# Altium schematic sheet LED's Section_2.SchDoc
size A3; DocumentNumber: 5; SheetNumber: 5; SheetTotal: 7
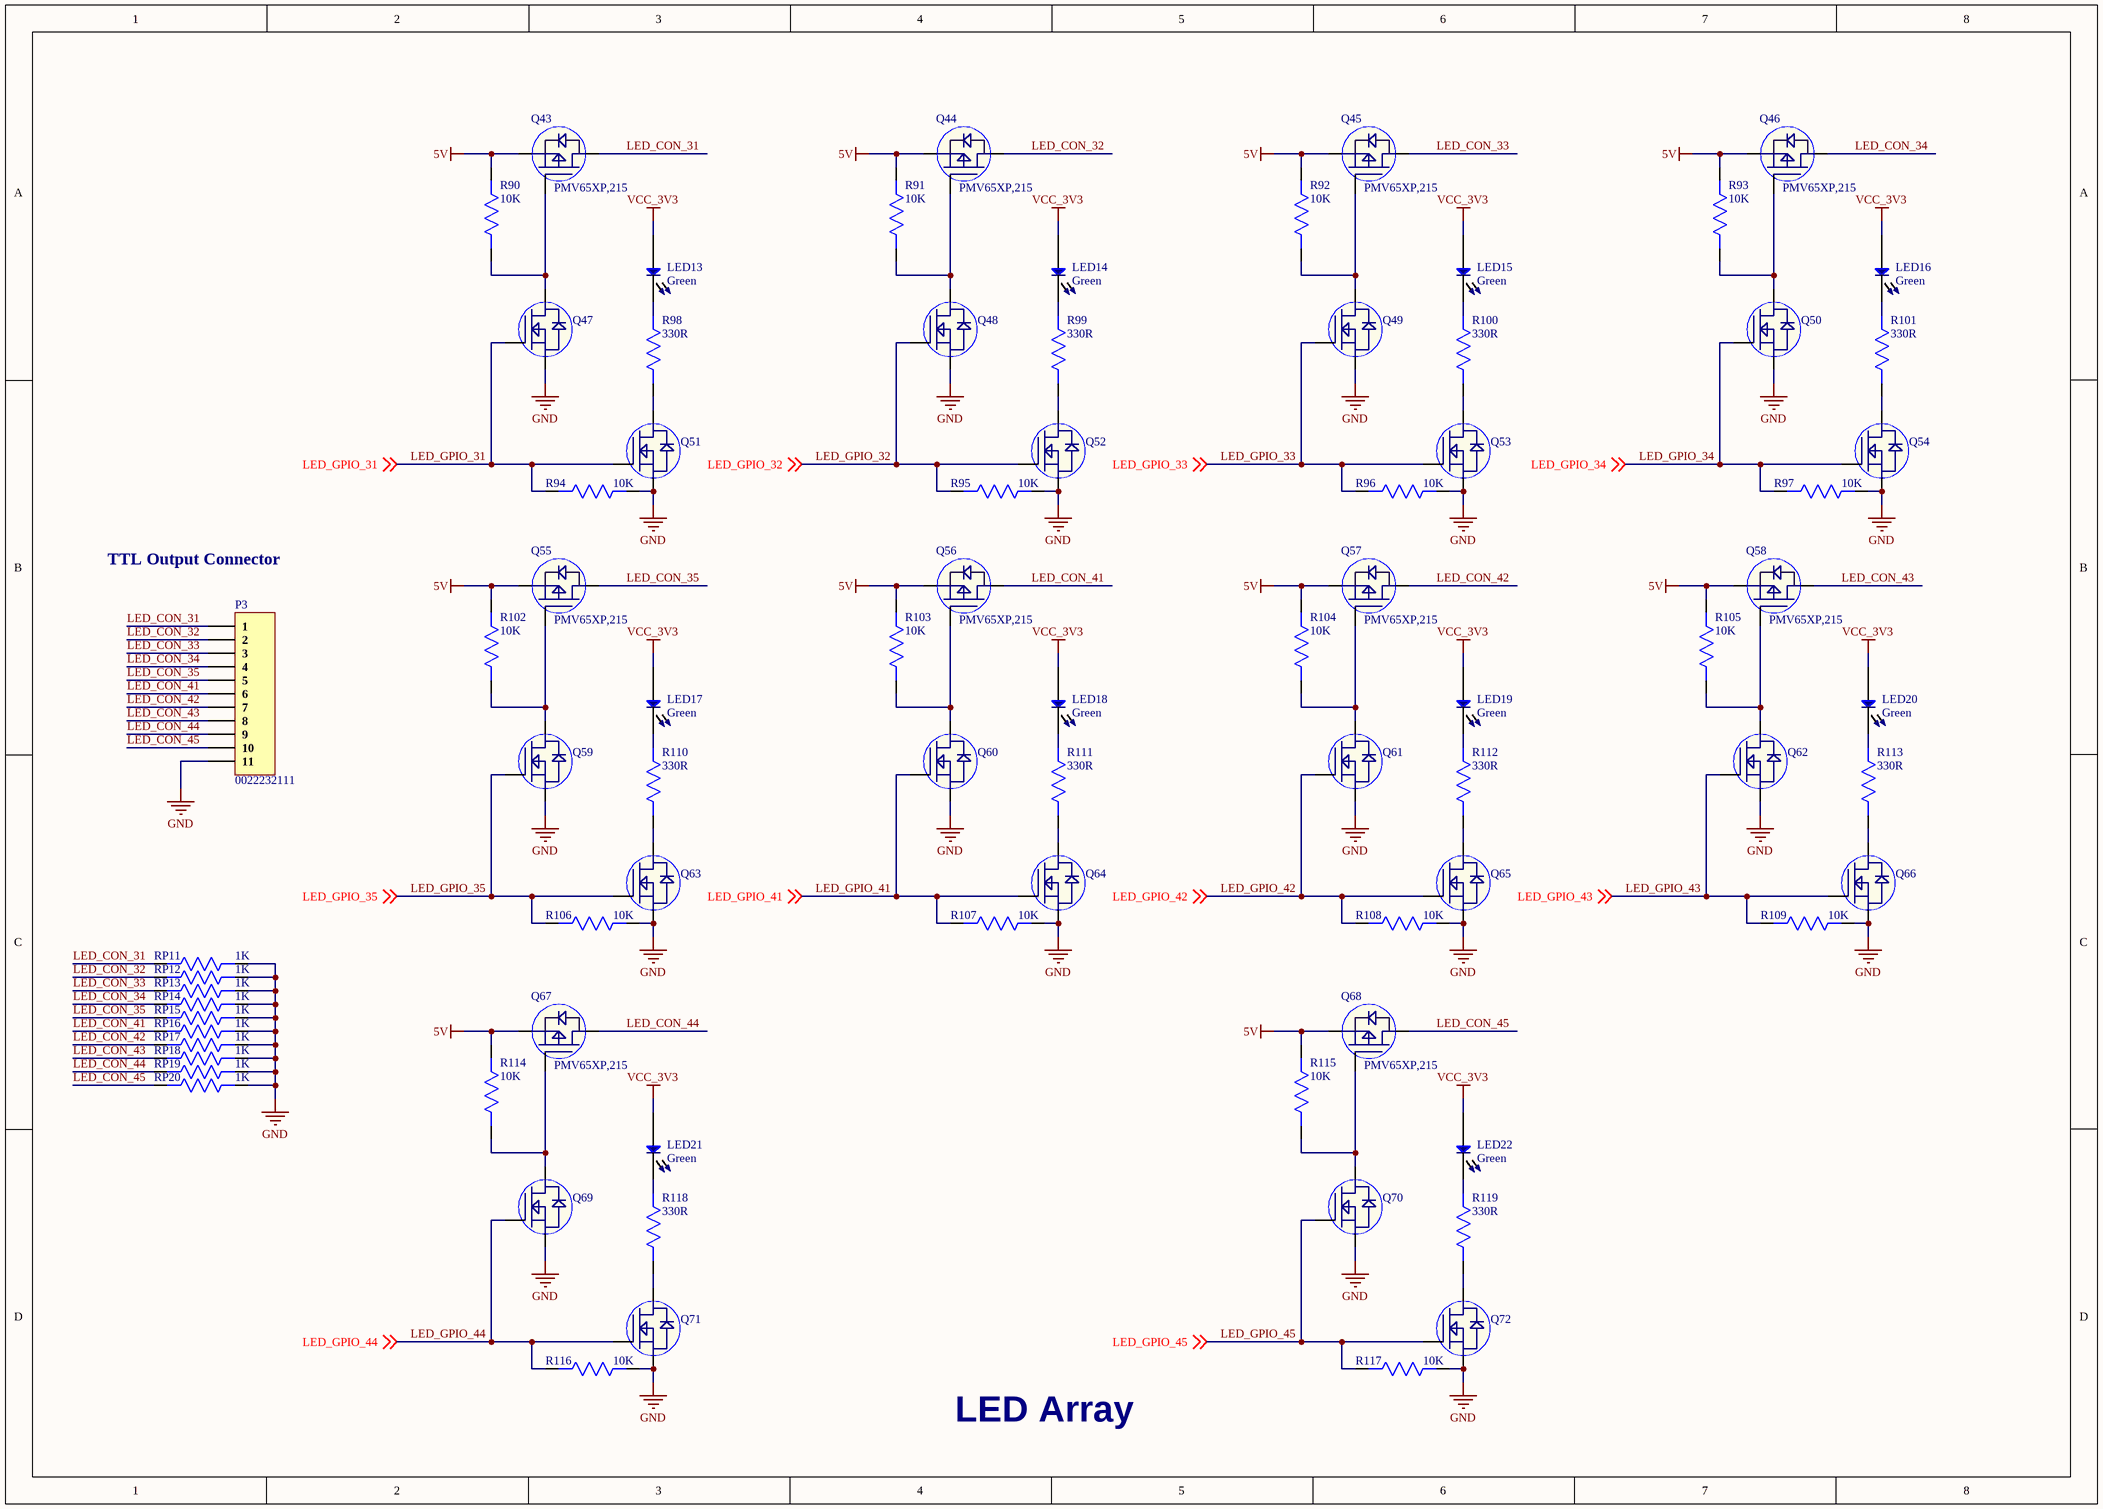
[diagram p0: LED's Section_2.SchDoc]

## Parts
LED13  Color: Green  [LED SMT]  (hidden comment: LTST-C190KGKT)
LED14  Color: Green  [LED SMT]  (hidden comment: LTST-C190KGKT)
LED15  Color: Green  [LED SMT]  (hidden comment: LTST-C190KGKT)
LED16  Color: Green  [LED SMT]  (hidden comment: LTST-C190KGKT)
LED17  Color: Green  [LED SMT]  (hidden comment: LTST-C190KGKT)
LED18  Color: Green  [LED SMT]  (hidden comment: LTST-C190KGKT)
LED19  Color: Green  [LED SMT]  (hidden comment: LTST-C190KGKT)
LED20  Color: Green  [LED SMT]  (hidden comment: LTST-C190KGKT)
LED21  Color: Green  [LED SMT]  (hidden comment: LTST-C190KGKT)
LED22  Color: Green  [LED SMT]  (hidden comment: LTST-C190KGKT)
P3  0022232111  [0022232111]
Q43  PMV65XP,215  [SOT23-3]
Q44  PMV65XP,215  [SOT23-3]
Q45  PMV65XP,215  [SOT23-3]
Q46  PMV65XP,215  [SOT23-3]
Q47  BSS138LT1G  [SOT23-3]  (value not drawn)
Q48  BSS138LT1G  [SOT23-3]  (value not drawn)
Q49  BSS138LT1G  [SOT23-3]  (value not drawn)
Q50  BSS138LT1G  [SOT23-3]  (value not drawn)
Q51  BSS138LT1G  [SOT23-3]  (value not drawn)
Q52  BSS138LT1G  [SOT23-3]  (value not drawn)
Q53  BSS138LT1G  [SOT23-3]  (value not drawn)
Q54  BSS138LT1G  [SOT23-3]  (value not drawn)
Q55  PMV65XP,215  [SOT23-3]
Q56  PMV65XP,215  [SOT23-3]
Q57  PMV65XP,215  [SOT23-3]
Q58  PMV65XP,215  [SOT23-3]
Q59  BSS138LT1G  [SOT23-3]  (value not drawn)
Q60  BSS138LT1G  [SOT23-3]  (value not drawn)
Q61  BSS138LT1G  [SOT23-3]  (value not drawn)
Q62  BSS138LT1G  [SOT23-3]  (value not drawn)
Q63  BSS138LT1G  [SOT23-3]  (value not drawn)
Q64  BSS138LT1G  [SOT23-3]  (value not drawn)
Q65  BSS138LT1G  [SOT23-3]  (value not drawn)
Q66  BSS138LT1G  [SOT23-3]  (value not drawn)
Q67  PMV65XP,215  [SOT23-3]
Q68  PMV65XP,215  [SOT23-3]
Q69  BSS138LT1G  [SOT23-3]  (value not drawn)
Q70  BSS138LT1G  [SOT23-3]  (value not drawn)
Q71  BSS138LT1G  [SOT23-3]  (value not drawn)
Q72  BSS138LT1G  [SOT23-3]  (value not drawn)
R90  10K  [Res0402]
R91  10K  [Res0402]
R92  10K  [Res0402]
R93  10K  [Res0402]
R94  10K  [Res0402]
R95  10K  [Res0402]
R96  10K  [Res0402]
R97  10K  [Res0402]
R98  330R  [Res0402]
R99  330R  [Res0402]
R100  330R  [Res0402]
R101  330R  [Res0402]
R102  10K  [Res0402]
R103  10K  [Res0402]
R104  10K  [Res0402]
R105  10K  [Res0402]
R106  10K  [Res0402]
R107  10K  [Res0402]
R108  10K  [Res0402]
R109  10K  [Res0402]
R110  330R  [Res0402]
R111  330R  [Res0402]
R112  330R  [Res0402]
R113  330R  [Res0402]
R114  10K  [Res0402]
R115  10K  [Res0402]
R116  10K  [Res0402]
R117  10K  [Res0402]
R118  330R  [Res0402]
R119  330R  [Res0402]
RP11  1K  [Res0402]
RP12  1K  [Res0402]
RP13  1K  [Res0402]
RP14  1K  [Res0402]
RP15  1K  [Res0402]
RP16  1K  [Res0402]
RP17  1K  [Res0402]
RP18  1K  [Res0402]
RP19  1K  [Res0402]
RP20  1K  [Res0402]

## Nets
5V: Q43.2(S) Q44.2(S) Q45.2(S) Q46.2(S) Q55.2(S) Q56.2(S) Q57.2(S) Q58.2(S) Q67.2(S) Q68.2(S) R90.2 R91.2 R92.2 R93.2 R102.2 R103.2 R104.2 R105.2 R114.2 R115.2
GND: P3.11 Q47.2(S) Q48.2(S) Q49.2(S) Q50.2(S) Q51.2(S) Q52.2(S) Q53.2(S) Q54.2(S) Q59.2(S) Q60.2(S) Q61.2(S) Q62.2(S) Q63.2(S) Q64.2(S) Q65.2(S) Q66.2(S) Q69.2(S) Q70.2(S) Q71.2(S) Q72.2(S) R94.2 R95.2 R96.2 R97.2 R106.2 R107.2 R108.2 R109.2 R116.2 R117.2 RP11.1 RP12.1 RP13.1 RP14.1 RP15.1 RP16.1 RP17.1 RP18.1 RP19.1 RP20.1
VCC_3V3: LED13.1 LED14.1 LED15.1 LED16.1 LED17.1 LED18.1 LED19.1 LED20.1 LED21.1 LED22.1
LED_CON_31: P3.1 Q43.3(D) RP11.2
LED_CON_32: P3.2 Q44.3(D) RP12.2
LED_CON_33: P3.3 Q45.3(D) RP13.2
LED_CON_34: P3.4 Q46.3(D) RP14.2
LED_CON_35: P3.5 Q55.3(D) RP15.2
LED_CON_41: P3.6 Q56.3(D) RP16.2
LED_CON_42: P3.7 Q57.3(D) RP17.2
LED_CON_43: P3.8 Q58.3(D) RP18.2
LED_CON_44: P3.9 Q67.3(D) RP19.2
LED_CON_45: P3.10 Q68.3(D) RP20.2
LED_GPIO_31: Q47.1(G) Q51.1(G) R94.1 ; off-sheet LED_GPIO_31
LED_GPIO_32: Q48.1(G) Q52.1(G) R95.1 ; off-sheet LED_GPIO_32
LED_GPIO_33: Q49.1(G) Q53.1(G) R96.1 ; off-sheet LED_GPIO_33
LED_GPIO_34: Q50.1(G) Q54.1(G) R97.1 ; off-sheet LED_GPIO_34
LED_GPIO_35: Q59.1(G) Q63.1(G) R106.1 ; off-sheet LED_GPIO_35
LED_GPIO_41: Q60.1(G) Q64.1(G) R107.1 ; off-sheet LED_GPIO_41
LED_GPIO_42: Q61.1(G) Q65.1(G) R108.1 ; off-sheet LED_GPIO_42
LED_GPIO_43: Q62.1(G) Q66.1(G) R109.1 ; off-sheet LED_GPIO_43
LED_GPIO_44: Q69.1(G) Q71.1(G) R116.1 ; off-sheet LED_GPIO_44
LED_GPIO_45: Q70.1(G) Q72.1(G) R117.1 ; off-sheet LED_GPIO_45
NetLED13_2: LED13.2 R98.1
NetLED14_2: LED14.2 R99.1
NetLED15_2: LED15.2 R100.1
NetLED16_2: LED16.2 R101.1
NetLED17_2: LED17.2 R110.1
NetLED18_2: LED18.2 R111.1
NetLED19_2: LED19.2 R112.1
NetLED20_2: LED20.2 R113.1
NetLED21_2: LED21.2 R118.1
NetLED22_2: LED22.2 R119.1
NetQ43_1: Q43.1(G) Q47.3(D) R90.1
NetQ44_1: Q44.1(G) Q48.3(D) R91.1
NetQ45_1: Q45.1(G) Q49.3(D) R92.1
NetQ46_1: Q46.1(G) Q50.3(D) R93.1
NetQ51_3: Q51.3(D) R98.2
NetQ52_3: Q52.3(D) R99.2
NetQ53_3: Q53.3(D) R100.2
NetQ54_3: Q54.3(D) R101.2
NetQ55_1: Q55.1(G) Q59.3(D) R102.1
NetQ56_1: Q56.1(G) Q60.3(D) R103.1
NetQ57_1: Q57.1(G) Q61.3(D) R104.1
NetQ58_1: Q58.1(G) Q62.3(D) R105.1
NetQ63_3: Q63.3(D) R110.2
NetQ64_3: Q64.3(D) R111.2
NetQ65_3: Q65.3(D) R112.2
NetQ66_3: Q66.3(D) R113.2
NetQ67_1: Q67.1(G) Q69.3(D) R114.1
NetQ68_1: Q68.1(G) Q70.3(D) R115.1
NetQ71_3: Q71.3(D) R118.2
NetQ72_3: Q72.3(D) R119.2

## Notes on the sheet
- TTL Output Connector
- LED Array

## Library data of the parts
LED13-LED22 = LTST-C190KGKT: LED GREEN CLEAR CHIP SMD; Manufacturer: Vishay Lite-On; Lens Color: Colorless; Lens Style: Diffused,Colorless,Rectangular,Clear; Forward Voltage: 2V; Luminous Intensity: 35mcd; Viewing Angle: 130°; Dominant Wavelength: 571nm; Test Current: 20mA; Wavelength: 574nm; Forward Current: 30mA; Power Rating: 75mW; Number of Elements: 1; Reverse Voltage: 5V; Supplier 1: Digi-Key; Manufacturer Part Number: LTST-C190KGKT; Stock 1: 1327387; Pricing 1: 1=0.26, 10=0.188, 25=0.138, 100=0.0987, 250=0.06712, 500=0.05922, 1000=0.04639 (USD); Mount: Surface Mount; Case/Package: 0603; Number of Pins: 2; Case Code (Metric): 1608; Case Code (Imperial): 0603; Min Operating Temperature: -55°C; Max Operating Temperature: 85°C; Packaging: Tape and Reel; Package Quantity: 1; Lens Transparency: Clear; Illumination Color: Green; Power Dissipation: 75mW; Number of LEDs: 1; Length: 1.6mm; Height: 0.8mm; Width: 0.8mm; Depth: 0.8mm; Radiation Hardening: No; Lead Free: Lead Free; ComponentLink1URL: https://www.verical.com/server-webapp/html/getDatasheet?partID=141494&src-supplier=Verical; ComponentLink1Description: https://www.verical.com/server-webapp/html/getDatasheet?partID=141494&src-supplier=Verical; ComponentLink2URL: http://optoelectronics.liteon.com/upload/download/DS22-2000-074/LTST-C190KGKT.PDF?src-supplier=Digi-Key; ComponentLink2Description: http://optoelectronics.liteon.com/upload/download/DS22-2000-074/LTST-C190KGKT.PDF?src-supplier=Digi-Key; ComponentLink3URL: http://www.mouser.com/ds/2/239/LTST-C190KGKT-1141861.pdf?src-supplier=Mouser; ComponentLink3Description: http://www.mouser.com/ds/2/239/LTST-C190KGKT-1141861.pdf?src-supplier=Mouser; ComponentLink4URL: http://uk.rs-online.com/webdocs/0dc0/0900766b80dc02a8.pdf?src-supplier=RSComponents; ComponentLink4Description: http://uk.rs-online.com/webdocs/0dc0/0900766b80dc02a8.pdf?src-supplier=RSComponents; Supplier Part Number 1: 160-1435-6-ND
P3 = 0022232111: CONN HEADER VERT 11POS 2.54MM; Manufacturer: Molex; Contact Resistance: 10mR; Number of Contacts: 11; Gender: Male; Supplier 1: Digi-Key; Manufacturer Part Number: 0022232111; Stock 1: 1529; Pricing 1: 1=0.74, 10=0.652, 100=0.5628, 500=0.46046, 1000=0.4093, 5000=0.35813, 10000=0.34023 (USD); Contact Plating: Copper,Tin; Contact Material: Brass; Housing Color: White; Housing Material: Nylon; Min Operating Temperature: 0°C; Max Operating Temperature: 75°C; Number of Rows: 1; Packaging: Bag; Termination: Solder; Orientation: Straight; Length: 27.94mm; Pitch: 2.54mm; Depth: 6.35mm; ComponentLink1URL: http://components.arrow.com/part/dataview/4703620S3674830N3303?src-supplier=Arrow; ComponentLink1Description: http://components.arrow.com/part/dataview/4703620S3674830N3303?src-supplier=Arrow; Supplier Part Number 1: 23-0022232111-ND
Q43-Q46 Q55-Q58 Q67 Q68 = PMV65XP,215: MOSFET P-CH 20V 2.8A SOT-23; Manufacturer: Nexperia; Supplier 1: Digi-Key; Manufacturer Part Number: PMV65XP,215; Stock 1: 60287; Pricing 1: 1=0.38, 10=0.28, 25=0.2452, 100=0.133, 250=0.13232, 500=0.1085, 1000=0.0805 (USD); Supplier Part Number 1: 1727-3124-1-ND
Q47-Q54 Q59-Q66 Q69-Q72 = BSS138LT1G: MOSFET N-CH 50V 200MA SOT-23; Manufacturer: ON Semiconductor; Gate to Source Voltage (Vgs): 20V; Nominal Vgs: 1.5V; Rds On Max: 3.5R; Input Capacitance: 50pF; Number of Elements: 1; Max Power Dissipation: 225mW; Turn-Off Delay Time: 20ns; Element Configuration: Single; ComponentLink1URL: https://datasheet.ciiva.com/22641/1596366-22641636.pdf; ComponentLink1Description: https://datasheet.ciiva.com/22641/1596366-22641636.pdf; ComponentLink2URL: https://datasheet.ciiva.com/1190/1596366-1190137.pdf; ComponentLink2Description: https://datasheet.ciiva.com/1190/1596366-1190137.pdf; ComponentLink3URL: https://datasheet.ciiva.com/15198/getdatasheetpartid-110266-15198908.pdf; ComponentLink3Description: https://datasheet.ciiva.com/15198/getdatasheetpartid-110266-15198908.pdf; ComponentLink4URL: https://datasheet.ciiva.com/8115/bss138lt1-d-8115295.pdf; ComponentLink4Description: https://datasheet.ciiva.com/8115/bss138lt1-d-8115295.pdf; ComponentLink5URL: https://datasheet.ciiva.com/8115/bss138lt1-d-8115358.pdf; ComponentLink5Description: https://datasheet.ciiva.com/8115/bss138lt1-d-8115358.pdf; ComponentLink6URL: https://datasheet.ciiva.com/1190/1596366-1190136.pdf; ComponentLink6Description: https://datasheet.ciiva.com/1190/1596366-1190136.pdf; ComponentLink7URL: https://datasheet.ciiva.com/936/bss138lt1-d-936802.pdf; ComponentLink7Description: https://datasheet.ciiva.com/936/bss138lt1-d-936802.pdf; ComponentLink8URL: https://datasheet.ciiva.com/936/bss138lt1-d-936801.pdf; ComponentLink8Description: https://datasheet.ciiva.com/936/bss138lt1-d-936801.pdf; ComponentLink9URL: https://datasheet.ciiva.com/14553/70099493-14553829.pdf; ComponentLink9Description: https://datasheet.ciiva.com/14553/70099493-14553829.pdf; ComponentLink10URL: https://datasheet.ciiva.com/936/bss138lt1-d-936803.pdf; ComponentLink10Description: https://datasheet.ciiva.com/936/bss138lt1-d-936803.pdf; Supplier 1: Digi-Key; Manufacturer Part Number: BSS138LT1G; Stock 1: 1283212; Pricing 1: 1=0.27, 10=0.222, 100=0.1177, 500=0.07746, 1000=0.05267 (USD); Case/Package: SOT-23-3; Number of Pins: 3; Contact Plating: Tin,Matte; Min Operating Temperature: -55°C; Max Operating Temperature: 150°C; Continuous Drain Current (ID): 200mA; Package Quantity: 1; Packaging: Tape and Reel; Drain to Source Breakdown Voltage: 50V; Power Dissipation: 225mW; Drain to Source Resistance: 3.5R; Threshold Voltage: 1.5V; Turn-On Delay Time: 20ns; Voltage Rating (DC): 50V; Current Rating: 200mA; On-State Resistance: 3.5R; Length: 3.04mm; Height: 1.01mm; Width: 1.4mm; Radiation Hardening: No; REACH SVHC: No SVHC; Lead Free: Lead Free; Halogen Free: Halogen Free; ComponentLink11URL: http://www.onsemi.com/pub/Collateral/BSS138LT1-D.PDF?src-supplier=Digi-Key; ComponentLink11Description: http://www.onsemi.com/pub/Collateral/BSS138LT1-D.PDF?src-supplier=Digi-Key; ComponentLink12URL: http://www.farnell.com/datasheets/1596366.pdf?src-supplier=Element14; ComponentLink12Description: http://www.farnell.com/datasheets/1596366.pdf?src-supplier=Element14; ComponentLink13URL: http://www.alliedelec.com/m/d/b3c6fd7d92596813fe75d33dcbaaae90.pdf?src-supplier=Allied+Electronics; ComponentLink13Description: http://www.alliedelec.com/m/d/b3c6fd7d92596813fe75d33dcbaaae90.pdf?src-supplier=Allied+Electronics; ComponentLink14URL: https://www.verical.com/server-webapp/html/getDatasheet?partID=110266&src-supplier=Verical; ComponentLink14Description: https://www.verical.com/server-webapp/html/getDatasheet?partID=110266&src-supplier=Verical; ComponentLink15URL: http://www.onsemi.com/pub_link/Collateral/BSS138LT1-D.PDF?src-supplier=Avnet; ComponentLink15Description: http://www.onsemi.com/pub_link/Collateral/BSS138LT1-D.PDF?src-supplier=Avnet; Supplier Part Number 1: BSS138LT1GOSDKR-ND
R90-R97 R102-R109 R114-R117 = RC0402FR-0710KL: RES SMD 10K OHM 1% 1/16W 0402; Manufacturer: Yageo Phycomp; Temperature Coefficient: 100ppm/°C; Resistance: 10000R; Voltage Rating (DC): 50V; Power Rating: 63mW; Supplier 1: Digi-Key; Manufacturer Part Number: RC0402FR-0710KL; Stock 1: 98435877; Pricing 1: 1=0.1, 10=0.016, 100=0.0067, 1000=0.00301, 2500=0.00261, 5000=0.00215 (USD); Mount: Surface Mount; Case/Package: 0402; Number of Pins: 2; Min Operating Temperature: -55°C; Max Operating Temperature: 155°C; Tolerance: 1%; Packaging: Cut Tape; Length: 1mm; Height: 0.32mm; Width: 500um; Depth: 0.5mm; REACH SVHC: No SVHC; Lead Free: Lead Free; Supplier Part Number 1: 311-10.0KLRCT-ND
R98-R101 R110-R113 R118 R119 = RC0402FR-07330RL: RES SMD 330 OHM 1% 1/16W 0402; Manufacturer: Yageo; Power Rating: 62.5mW; Voltage Rating: 50V; Temperature Coefficient: 100ppm/°C; Max Power Dissipation: 63mW; ComponentLink1URL: http://www.farnell.com/datasheets/1784430.pdf?src-supplier=Element14; ComponentLink1Description: http://www.farnell.com/datasheets/1784430.pdf?src-supplier=Element14; ComponentLink2URL: http://www.yageo.com/documents/recent/PYu-RC_Group_51_RoHS_L_9.pdf?src-supplier=Mouser; ComponentLink2Description: http://www.yageo.com/documents/recent/PYu-RC_Group_51_RoHS_L_9.pdf?src-supplier=Mouser; ComponentLink3URL: http://www.yageo.com/documents/recent/PYu-RC0402_51_RoHS_L_6_r.pdf?src-supplier=Future+Electronics; ComponentLink3Description: http://www.yageo.com/documents/recent/PYu-RC0402_51_RoHS_L_6_r.pdf?src-supplier=Future+Electronics; ComponentLink4URL: https://www.verical.com/server-webapp/html/getDatasheet?partID=329466&src-supplier=Verical; ComponentLink4Description: https://www.verical.com/server-webapp/html/getDatasheet?partID=329466&src-supplier=Verical; ComponentLink5URL: http://www.farnell.com/datasheets/1018594.pdf?src-supplier=Element14; ComponentLink5Description: http://www.farnell.com/datasheets/1018594.pdf?src-supplier=Element14; ComponentLink6URL: http://www.farnell.com/datasheets/2167052.pdf?src-supplier=Element14; ComponentLink6Description: http://www.farnell.com/datasheets/2167052.pdf?src-supplier=Element14; ComponentLink7URL: http://documents.rs-components.com/techlib://itc_doclist_GB.htm?stockno=6185810&src-supplier=RSComponents; ComponentLink7Description: http://documents.rs-components.com/techlib://itc_doclist_GB.htm?stockno=6185810&src-supplier=RSComponents; Supplier 1: Digi-Key; Manufacturer Part Number: RC0402FR-07330RL; Stock 1: 6258760; Pricing 1: 1=0.1, 10=0.016, 100=0.0067, 1000=0.003, 2500=0.0026, 5000=0.0022 (USD); Case/Package: 0402; Case Code (Metric): 1005; Case Code (Imperial): 0402; Min Operating Temperature: -55°C; Max Operating Temperature: 155°C; Packaging: Tape and Reel; Resistance: 330R; Tolerance: 1%; Composition: Thick Film; Termination: SMD/SMT; Military Standard: Not; Package Quantity: 1; Number of Terminations: 2; Features: Moisture Resistant; Length: 0.039inch; Height: 0.016inch; Depth: 0.5mm; Width: 0.02inch; REACH SVHC: Unknown; Lead Free: Lead Free; ComponentLink8URL: http://www.yageo.com/documents/recent/PYu-RC_Group_51_RoHS_L_10.pdf?src-supplier=Digi-Key; ComponentLink8Description: http://www.yageo.com/documents/recent/PYu-RC_Group_51_RoHS_L_10.pdf?src-supplier=Digi-Key; ComponentLink9URL: http://www.mouser.com/ds/2/447/PYu-RC0402_51_RoHS_L_6_r-8721.pdf?src-supplier=Mouser; ComponentLink9Description: http://www.mouser.com/ds/2/447/PYu-RC0402_51_RoHS_L_6_r-8721.pdf?src-supplier=Mouser; Supplier Part Number 1: 311-330LRCT-ND
RP11-RP20 = AT0402FRE071KL: RES SMD 1K OHM 1% 1/16W 0402; Manufacturer: Yageo; Resistance: 1kR; Max Power Dissipation: 63mW; Temperature Coefficient: 50ppm/°C; Supplier 1: Digi-Key; Manufacturer Part Number: AT0402FRE071KL; RoHS: Yes; Category: Chip SMD Resistors; Stock 1: 559; Pricing 1: 1=0.14000, 10=0.11800, 100=0.04620, 1000=0.01935, 2500=0.01774, 5000=0.01612 (USD); Case/Package: 0402; Case Code (Metric): 1005; Case Code (Imperial): 0402; Min Operating Temperature: -55°C; Max Operating Temperature: 155°C; Packaging: Tape and Reel; Resistor Type: Thin Film; Number of Terminations: 2; Tolerance: 1%; Features: Moisture Resistant,Automotive AEC-Q200,Anti-Sulfur; Length: 0.039inch; Width: 0.02inch; Height: 0.014inch; RoHS Compliant: Yes; ComponentLink1URL: http://www.yageo.com/documents/recent/PYu-AT_51_RoHS_L-3.pdf?src-supplier=Digi-Key; ComponentLink1Description: http://www.yageo.com/documents/recent/PYu-AT_51_RoHS_L-3.pdf?src-supplier=Digi-Key; ComponentLink2URL: http://www.yageo.com/documents/recent/PYu-AT_51_RoHS_L_5.pdf?src-supplier=Digi-Key; ComponentLink2Description: http://www.yageo.com/documents/recent/PYu-AT_51_RoHS_L_5.pdf?src-supplier=Digi-Key; Supplier Part Number 1: YAG2105CT-ND